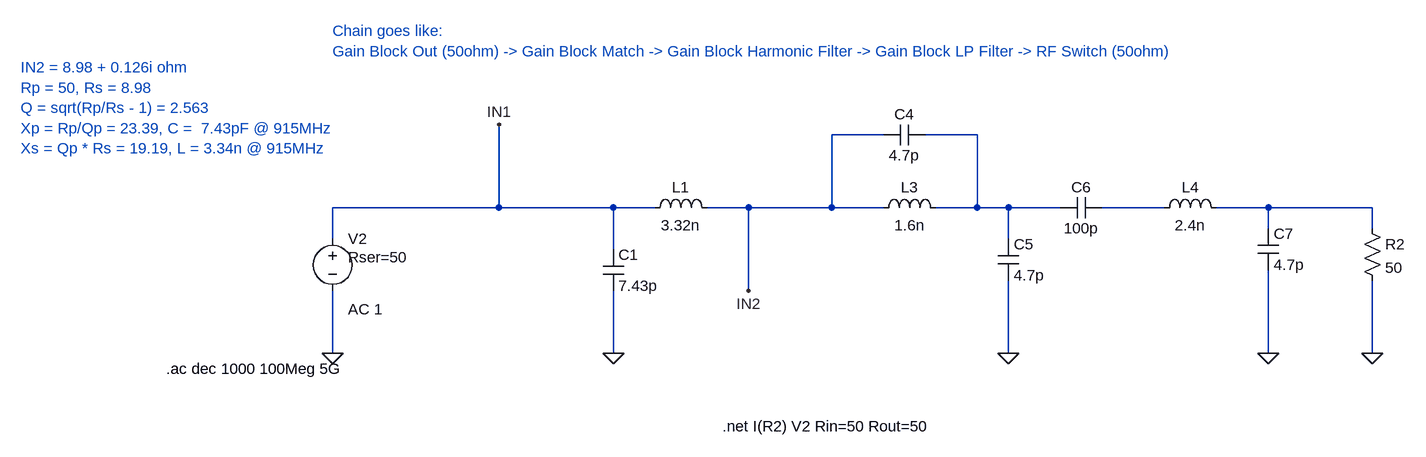
[diagram p0: schematic Gainblock_To_Switch_IdeaL.asc]
Gainblock_To_Switch_IdeaL.asc, the LTspice schematic file:
Version 4.1
SHEET 1 2040 740
WIRE 976 224 896 224
WIRE 1120 224 1040 224
WIRE 384 336 384 208
WIRE 384 336 128 336
WIRE 560 336 384 336
WIRE 624 336 560 336
WIRE 768 336 704 336
WIRE 896 336 896 224
WIRE 896 336 768 336
WIRE 976 336 896 336
WIRE 1120 336 1120 224
WIRE 1120 336 1056 336
WIRE 1168 336 1120 336
WIRE 1248 336 1168 336
WIRE 1408 336 1312 336
WIRE 1568 336 1488 336
WIRE 1728 336 1568 336
WIRE 1568 368 1568 336
WIRE 1728 368 1728 336
WIRE 128 384 128 336
WIRE 1168 384 1168 336
WIRE 560 400 560 336
WIRE 768 464 768 336
WIRE 128 560 128 464
WIRE 560 560 560 464
WIRE 1168 560 1168 448
WIRE 1568 560 1568 432
WIRE 1728 560 1728 448
FLAG 128 560 0
FLAG 560 560 0
FLAG 1168 560 0
FLAG 1568 560 0
FLAG 1728 560 0
FLAG 384 208 IN1
FLAG 768 464 IN2
SYMBOL voltage 128 368 R0
WINDOW 123 24 124 Left 2
WINDOW 39 24 44 Left 2
SYMATTR Value2 AC 1
SYMATTR SpiceLine Rser=50
SYMATTR InstName V2
SYMATTR Value ""
SYMBOL ind 960 352 R270
WINDOW 0 32 56 VTop 2
WINDOW 3 5 56 VBottom 2
SYMATTR InstName L3
SYMATTR Value 1.6n
SYMATTR SpiceLine Rser=1m
SYMBOL cap 1040 208 R90
WINDOW 0 0 32 VBottom 2
WINDOW 3 32 32 VTop 2
SYMATTR InstName C4
SYMATTR Value 4.7p
SYMBOL cap 1152 384 R0
SYMATTR InstName C5
SYMATTR Value 4.7p
SYMBOL cap 1312 320 R90
WINDOW 0 0 32 VBottom 2
WINDOW 3 32 32 VTop 2
SYMATTR InstName C6
SYMATTR Value 100p
SYMBOL ind 1392 352 R270
WINDOW 0 32 56 VTop 2
WINDOW 3 5 56 VBottom 2
SYMATTR InstName L4
SYMATTR Value 2.4n
SYMATTR SpiceLine Rser=1m
SYMBOL cap 1552 368 R0
SYMATTR InstName C7
SYMATTR Value 4.7p
SYMBOL res 1712 352 R0
SYMATTR InstName R2
SYMATTR Value 50
SYMBOL cap 544 400 R0
SYMATTR InstName C1
SYMATTR Value 7.43p
SYMBOL ind 608 352 R270
WINDOW 0 32 56 VTop 2
WINDOW 3 5 56 VBottom 2
SYMATTR InstName L1
SYMATTR Value 3.32n
SYMATTR SpiceLine Rser=1m
TEXT -128 584 Left 2 !.ac dec 1000 100Meg 5G
TEXT 128 64 Left 2 ;Chain goes like:\nGain Block Out (50ohm) -> Gain Block Match -> Gain Block Harmonic Filter -> Gain Block LP Filter -> RF Switch (50ohm)
TEXT -352 120 Left 2 ;IN2 = 8.98 + 0.126i ohm\nRp = 50, Rs = 8.98\nQ = sqrt(Rp/Rs - 1) = 2.563\nXp = Rp/Qp = 23.39, C =  7.43pF @ 915MHz\nXs = Qp * Rs = 19.19, L = 3.34n @ 915MHz
TEXT 728 672 Left 2 !.net I(R2) V2 Rin=50 Rout=50

The netlist it stands for:
* Gainblock_To_Switch_IdeaL.asc
V2 IN1 0 AC 1 Rser=50
L3 IN2 N001 1.6n Rser=1m
C4 N001 IN2 4.7p
C5 N001 0 4.7p
C6 N002 N001 100p
L4 N002 N003 2.4n Rser=1m
C7 N003 0 4.7p
R2 N003 0 50
C1 IN1 0 7.43p
L1 IN1 IN2 3.32n Rser=1m
.ac dec 1000 100Meg 5G
* Chain goes like:
* Gain Block Out (50ohm) -> Gain Block Match -> Gain Block Harmonic Filter -> Gain Block LP Filter -> RF Switch (50ohm)
* IN2 = 8.98 + 0.126i ohm
* Rp = 50, Rs = 8.98
* Q = sqrt(Rp/Rs - 1) = 2.563
* Xp = Rp/Qp = 23.39, C =  7.43pF @ 915MHz
* Xs = Qp * Rs = 19.19, L = 3.34n @ 915MHz
.net I(R2) V2 Rin=50 Rout=50
.backanno
.end

* Results of the author's LTspice run, read from the files saved beside the schematic
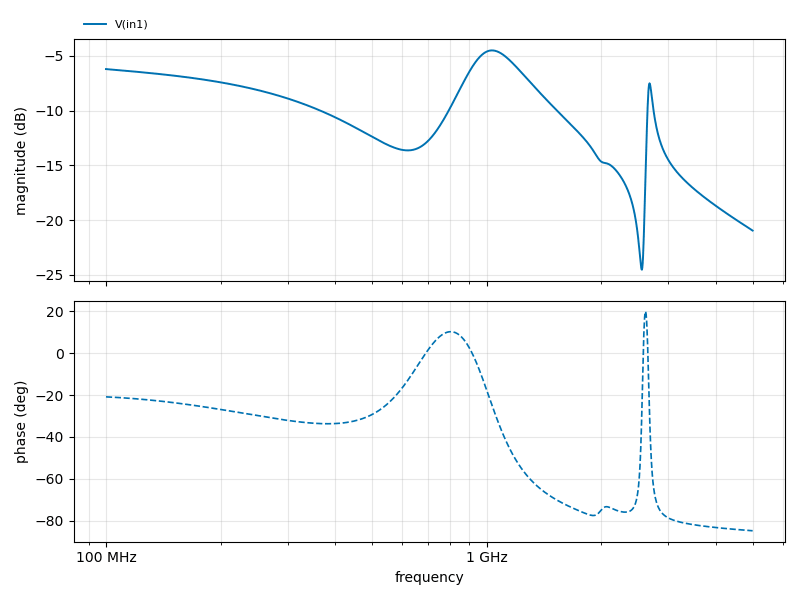
[diagram p1: AC Analysis of Gainblock_To_Switch_IdeaL.asc, plotted from the saved traces]
* AC Analysis, 1 run:
*   V(in1): -6.21 dB at 100 MHz, -20.95 dB at 5 GHz, peak -4.50 dB at 1.033 GHz, 3 dB below the peak at 866.3 MHz and 1.31 GHz